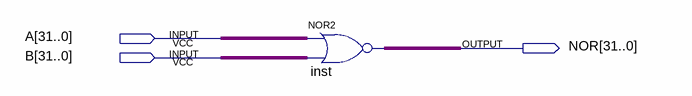
[diagram p0: schematic sheet]
// Quartus schematic Nor_32bit.bdf as structural Verilog: 1 symbols, 3 pins
module Nor_32bit (
  input  [31:0] A,
  input  [31:0] B,
  output [31:0] NOR
);

  assign NOR = ~(A | B);  // NOR2 inst, 32 bits wide
endmodule
